# EasyEDA Pro project stripline1.epro

# Board PCB1
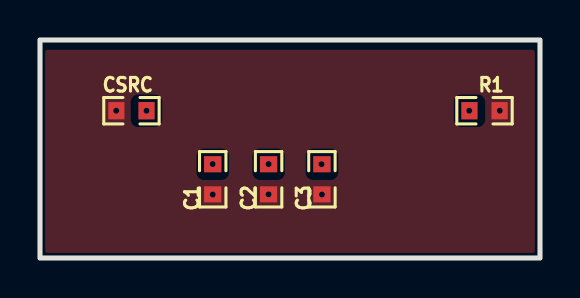
[diagram p0: board, top side]
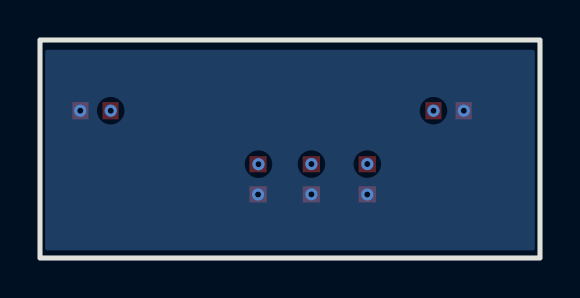
[diagram p1: board, bottom side, seen from below]

Outline 25 x 10.9 mm; copper layers: Top Layer, Inner1, Inner2, Bottom Layer. Coordinates in mm from the lower left corner of the outline.
Outline path: rectangle 0,10.9 25,0
Stack: Top Layer 0.035mm Outer layer thickness 1oz / Dielectric1 0.2mm 7628 RC49% 8.6mil / Inner1 0.35mm Inner layer thickness / Dielectric2 0.2mm 1.1mm H/HOZ Copper / Inner2 0.35mm Inner layer thickness / Dielectric3 0.2mm 7628 RC49% 8.6mil / Bottom Layer 0.035mm Outer layer thickness 1oz

## Design rules (mm)
template: Custom Config
spacing copperThickness1oz (default): track to track 0.102, other pairs 0.152 to 0.3
spacing copperThickness2oz: track to track 0.203, other pairs 0.152 to 0.3
track width copperThickness1oz (default): min 0.127, default 0.254, max 2.54
track width copperThickness2oz: min 0.203, default 0.254, max 2.54
differential pair differentialPair (default): width min 0.127, default 0.254, max 2.54; gap min 0.152, default 0.152
via viaSize (default): diameter min 0.5, default 0.61, max 10; hole min 0.3, default 0.305, max 6.3
pour e27 uses copperRegion
pour e89 uses copperRegion1

## Placement (name value [footprint] x y rotation side)
C1  1uF  [R0603]  8.64 3.94 270 top
C2  1uF  [R0603]  11.43 3.94 270 top
C3  1uF  [R0603]  14.1 3.94 270 top
CSRC  0  [R0603]  4.57 7.37 0 top
R1  50Ω  [R0603]  22.22 7.37 180 top

## Footprints (pads in the part's own frame, mm; a bottom-side part is the same pattern mirrored in y, then rotated)
R0603
  rect 0.806x0.864 smd: 1(-0.753,0) 2(0.753,0)

## Nets
1V: C3.1
3V: C2.1
+5V: C1.1
GND: C1.2 C2.2 C3.2 CSRC.1 R1.1
TX: CSRC.2 R1.2

## Via types
v1: diameter 0.61, hole 0.305, Top Layer to Bottom Layer, 10 vias

## Routing (per net, layer and track width the routed paths; a pad name or vN(x,y) marks a point on that pad's centre or on a via; arc(x,y) is an arc through that point)
1V:
  vias: v1(14.08,4.69)
3V:
  vias: v1(11.43,4.7)
+5V:
  vias: v1(8.64,4.7)
GND:
  vias: v1(3.81,7.37) v1(8.64,3.18) v1(11.43,3.18) v1(14.1,3.18) v1(22.99,7.37)
TX: length 16.1
  Inner1 w0.127: v1(5.33,7.37) v1(21.46,7.37)

## Copper pours and planes (outline as drawn; the poured copper is in the pictures)
1V on Inner2: 12.89,10.41 15.3,10.41 15.3,4.06 12.89,4.06
3V on Inner2: 10.22,10.41 12.64,10.41 12.64,4.06 10.22,4.06
+5V on Inner2: 7.49,10.41 9.91,10.41 9.91,4.06 7.49,4.06
GND on Top Layer: 0.25,10.41 24.76,10.41 24.76,0.25 0.25,0.25
GND on Bottom Layer: 0.25,10.41 24.76,10.41 24.76,0.38 0.25,0.38
